# Altium schematic sheet ffultra_MCU.SchDoc: Firefly Mini MCU
size Legal; DrawnBy: Jakub Czarny; SheetNumber: 2; SheetTotal: 13
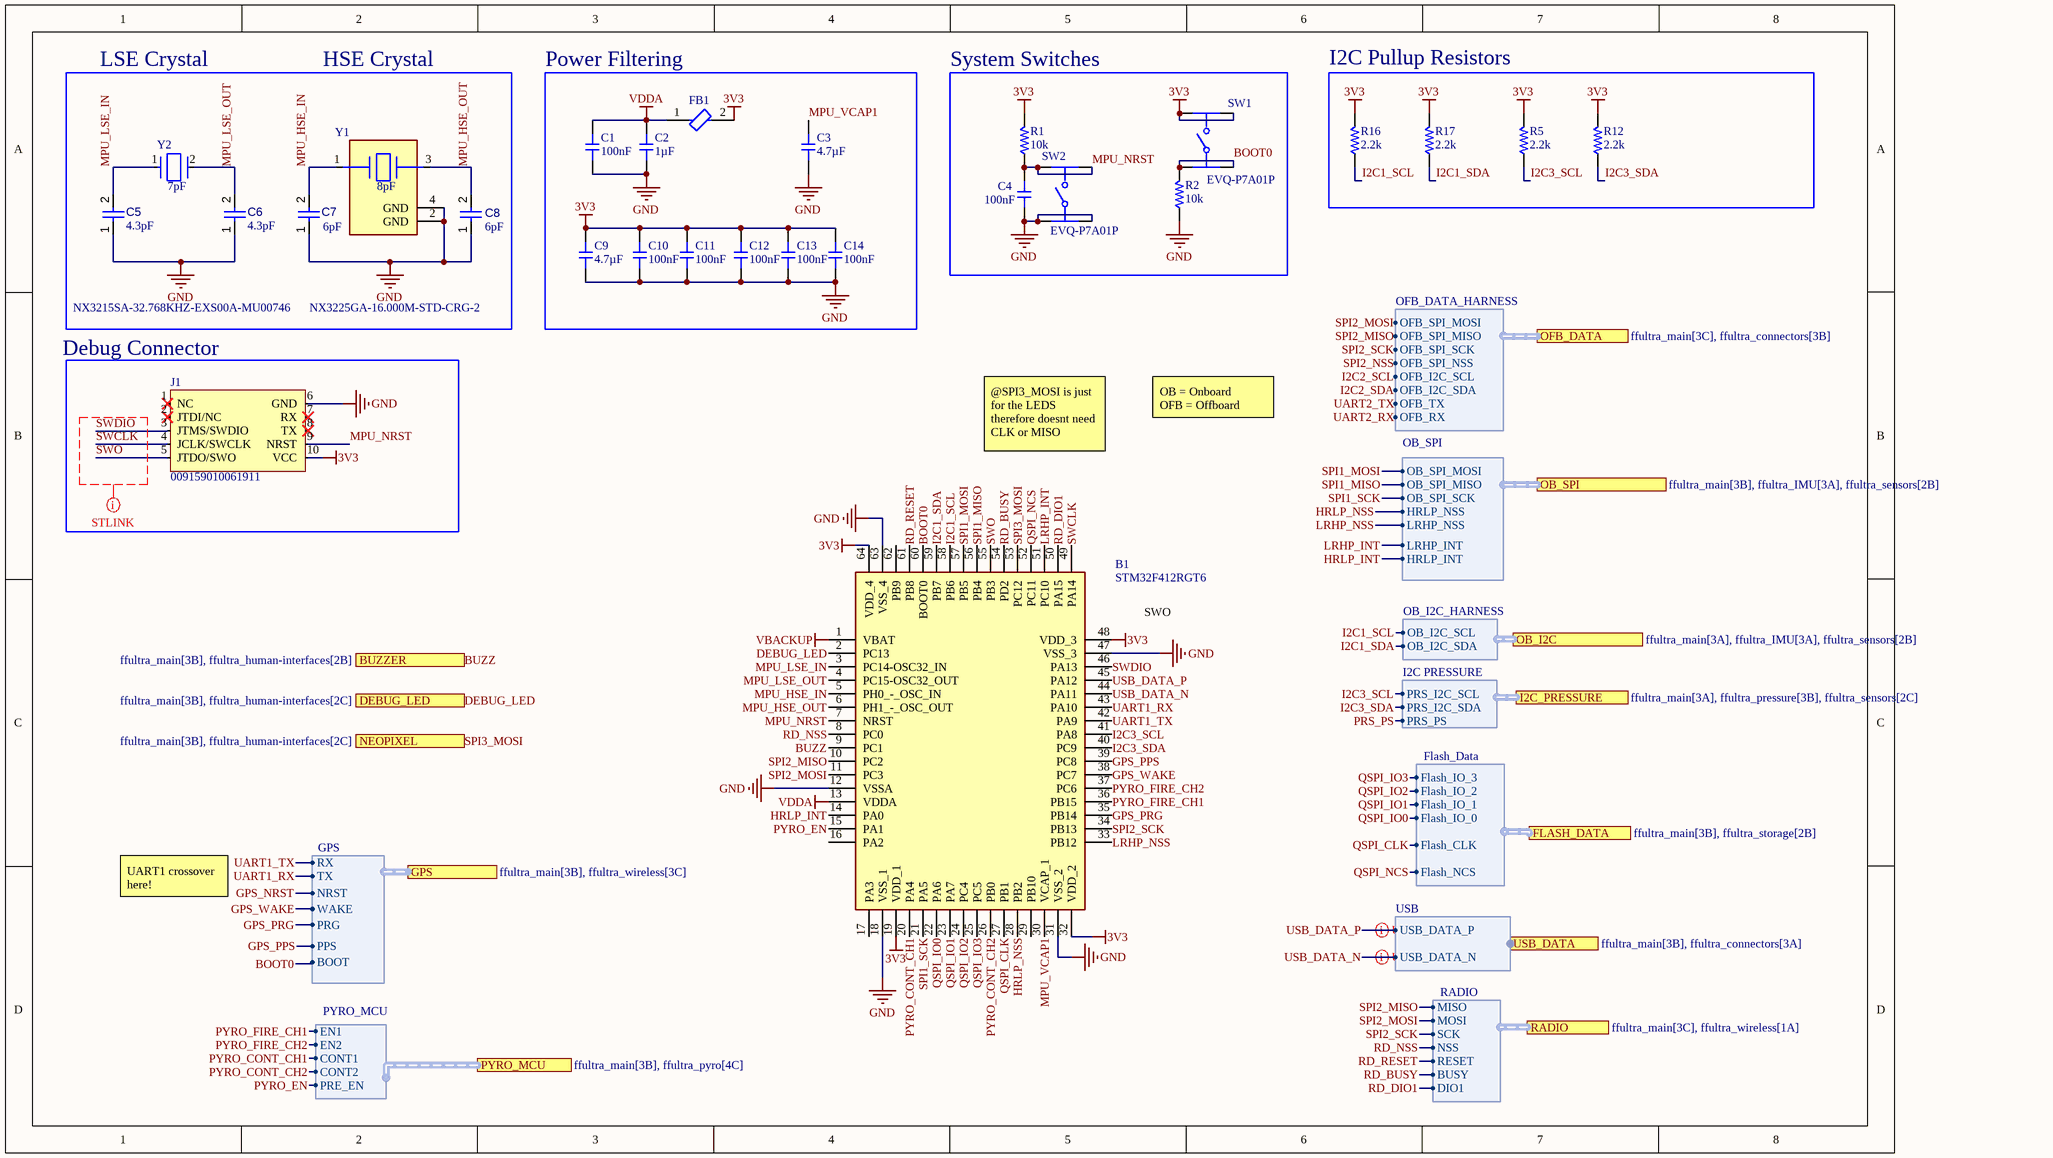
[diagram p0: ffultra_MCU.SchDoc]

## Parts
B1  STM32F412RGT6  [QFP50P1200X1200X160-64N]
C1  value 100nF  [CAP-0402]  (hidden comment: CL05B104KO5NNNC)
C2  value 1µF  [CAP-0402]  (hidden comment: CL05A105KA5NQNC)
C3  value 4.7µF  [CAP-0402]  (hidden comment: CL05A475MP5NRNC)
C4  value 100nF  [CAP-0402]  (hidden comment: CL05B104KO5NNNC)
C5  value 4.3pF  [CAP-0402]  (hidden comment: C1005NP0439CGTS)
C6  value 4.3pF  [CAP-0402]  (hidden comment: C1005NP0439CGTS)
C7  value 6pF  [CAP-0402]  (hidden comment: 0402CG6R0C500NT)
C8  value 6pF  [CAP-0402]  (hidden comment: 0402CG6R0C500NT)
C9  value 4.7µF  [CAP-0402]  (hidden comment: CL05A475MP5NRNC)
C10  value 100nF  [CAP-0402]  (hidden comment: CL05B104KO5NNNC)
C11  value 100nF  [CAP-0402]  (hidden comment: CL05B104KO5NNNC)
C12  value 100nF  [CAP-0402]  (hidden comment: CL05B104KO5NNNC)
C13  value 100nF  [CAP-0402]  (hidden comment: CL05B104KO5NNNC)
C14  value 100nF  [CAP-0402]  (hidden comment: CL05B104KO5NNNC)
FB1  BLM15AG601SN1D  [FP-BLM15-0_05-IPC_A]  (value not drawn)
J1  009159010061911  [009159010061911-Footprint-1]  (no BOM)
R1  value 10k  [RES-0402]  (hidden comment: 0402WGF1002TCE)
R2  value 10k  [RES-0402]  (hidden comment: 0402WGF1002TCE)
R5  value 2.2k  [RES-0402]  (hidden comment: 0402WGF2201TCE)
R12  value 2.2k  [RES-0402]  (hidden comment: 0402WGF2201TCE)
R16  value 2.2k  [RES-0402]  (hidden comment: 0402WGF2201TCE)
R17  value 2.2k  [RES-0402]  (hidden comment: 0402WGF2201TCE)
SW1  EVQ-P7A01P  [FP-EVQ-P7A01P-MFG]
SW2  EVQ-P7A01P  [FP-EVQ-P7A01P-MFG]
Y1  NX3225GA-16.000M-STD-CRG-2  value 8pF  [FP-NX3225GA-MFG]
Y2  NX3215SA-32.768KHZ-EXS00A-MU00746  value 7pF  [FP-NX3215SA-MFG]

## Blocks framed on the sheet
Power Filtering: C1-C3 C9-C14 FB1
System Switches: C4 R1 R2 SW1 SW2
I2C Pullup Resistors: R5 R12 R16 R17

## Ports
BUZZER (out, see ffultra_main[3B], ffultra_human-interfaces[2B]), DEBUG_LED (out, see ffultra_main[3B], ffultra_human-interfaces[2C]), FLASH_DATA (harness Flash_Data, see ffultra_main[3B], ffultra_storage[2B]), GPS (harness GPS, see ffultra_main[3B], ffultra_wireless[3C]), I2C_PRESSURE (harness I2C PRESSURE, see ffultra_main[3A], ffultra_pressure[3B], ffultra_sensors[2C]), NEOPIXEL (out, see ffultra_main[3B], ffultra_human-interfaces[2C]), OB_I2C (harness OB_I2C_HARNESS, see ffultra_main[3A], ffultra_IMU[3A], ffultra_sensors[2B]), OB_SPI (harness OB_SPI, see ffultra_main[3B], ffultra_IMU[3A], ffultra_sensors[2B]), OFB_DATA (harness OFB_DATA_HARNESS, see ffultra_main[3C], ffultra_connectors[3B]), PYRO_MCU (harness PYRO_MCU, see ffultra_main[3B], ffultra_pyro[4C]), RADIO (harness RADIO, see ffultra_main[3C], ffultra_wireless[1A]), USB_DATA (harness USB, see ffultra_main[3B], ffultra_connectors[3A])

## Harnesses
OB_I2C_HARNESS: OB_I2C_SCL, OB_I2C_SDA
Flash_Data: Flash_NCS, Flash_CLK, Flash_IO_0, Flash_IO_1, Flash_IO_2, Flash_IO_3
GPS: RX, TX, NRST, WAKE, PRG, PPS, BOOT
PYRO_MCU: EN1, EN2, CONT1, CONT2, PRE_EN
RADIO: MISO, MOSI, SCK, NSS, RESET, BUSY, DIO1
I2C PRESSURE: PRS_I2C_SCL, PRS_I2C_SDA, PRS_PS
USB: USB_DATA_P, USB_DATA_N
OFB_DATA_HARNESS: OFB_SPI_MOSI, OFB_SPI_MISO, OFB_SPI_SCK, OFB_I2C_SCL, OFB_I2C_SDA, OFB_SPI_NSS, OFB_TX, OFB_RX
OB_SPI: OB_SPI_MOSI, OB_SPI_MISO, OB_SPI_SCK, HRLP_INT, LRHP_NSS, HRLP_NSS, LRHP_INT

## Nets
3V3: B1.19(VDD_1) B1.32(VDD_2) B1.48(VDD_3) B1.64(VDD_4) C9.2 C10.2 C11.2 C12.2 C13.2 C14.2 FB1.2 J1.10(VCC) R1.2 R5.2 R12.2 R16.2 R17.2 SW1.1 SW1.1'
GND: B1.12(VSSA) B1.18(VSS_1) B1.31(VSS_2) B1.47(VSS_3) B1.63(VSS_4) C1.1 C2.1 C3.1 C4.1 C5.1 C6.1 C7.1 C8.1 C9.1 C10.1 C11.1 C12.1 C13.1 C14.1 J1.6(GND) R2.1 SW2.2 SW2.2' Y1.2(GND) Y1.4(GND)
VBACKUP: B1.1(VBAT)
VDDA: B1.13(VDDA) C1.2 C2.2 FB1.1
BOOT0: B1.60(BOOT0) R2.2 SW1.2 SW1.2' ; port GPS.BOOT
BUZZ: B1.9(PC1) ; port BUZZER
DEBUG_LED: B1.2(PC13) ; port DEBUG_LED
GPS_NRST: port GPS.NRST
GPS_PPS: B1.39(PC8) ; port GPS.PPS
GPS_PRG: B1.35(PB14) ; port GPS.PRG
GPS_WAKE: B1.38(PC7) ; port GPS.WAKE
HRLP_INT: B1.14(PA0) ; port OB_SPI.HRLP_INT
HRLP_NSS: B1.28(PB2) ; port OB_SPI.HRLP_NSS
I2C1_SCL: B1.58(PB6) R16.1 ; port OB_I2C.OB_I2C_SCL
I2C1_SDA: B1.59(PB7) R17.1 ; port OB_I2C.OB_I2C_SDA
I2C2_SCL: port OFB_DATA.OFB_I2C_SCL
I2C2_SDA: port OFB_DATA.OFB_I2C_SDA
I2C3_SCL: B1.41(PA8) R5.1 ; port I2C_PRESSURE.PRS_I2C_SCL
I2C3_SDA: B1.40(PC9) R12.1 ; port I2C_PRESSURE.PRS_I2C_SDA
LRHP_INT: B1.51(PC10) ; port OB_SPI.LRHP_INT
LRHP_NSS: B1.33(PB12) ; port OB_SPI.LRHP_NSS
MPU_HSE_IN: B1.5(PH0_-_OSC_IN) C7.2 Y1.1
MPU_HSE_OUT: B1.6(PH1_-_OSC_OUT) C8.2 Y1.3
MPU_LSE_IN: B1.3(PC14-OSC32_IN) C5.2 Y2.1
MPU_LSE_OUT: B1.4(PC15-OSC32_OUT) C6.2 Y2.2
MPU_NRST: B1.7(NRST) C4.2 J1.9(NRST) R1.1 SW2.1 SW2.1'
MPU_VCAP1: B1.30(VCAP_1) C3.2
PRS_PS: port I2C_PRESSURE.PRS_PS
PYRO_CONT_CH1: B1.20(PA4) ; port PYRO_MCU.CONT1
PYRO_CONT_CH2: B1.26(PB0) ; port PYRO_MCU.CONT2
PYRO_EN: B1.15(PA1) ; port PYRO_MCU.PRE_EN
PYRO_FIRE_CH1: B1.36(PB15) ; port PYRO_MCU.EN1
PYRO_FIRE_CH2: B1.37(PC6) ; port PYRO_MCU.EN2
QSPI_CLK: B1.27(PB1) ; port FLASH_DATA.Flash_CLK
QSPI_IO0: B1.22(PA6) ; port FLASH_DATA.Flash_IO_0
QSPI_IO1: B1.23(PA7) ; port FLASH_DATA.Flash_IO_1
QSPI_IO2: B1.24(PC4) ; port FLASH_DATA.Flash_IO_2
QSPI_IO3: B1.25(PC5) ; port FLASH_DATA.Flash_IO_3
QSPI_NCS: B1.52(PC11) ; port FLASH_DATA.Flash_NCS
RD_BUSY: B1.54(PD2) ; port RADIO.BUSY
RD_DIO1: B1.50(PA15) ; port RADIO.DIO1
RD_NSS: B1.8(PC0) ; port RADIO.NSS
RD_RESET: B1.61(PB8) ; port RADIO.RESET
SPI1_MISO: B1.56(PB4) ; port OB_SPI.OB_SPI_MISO
SPI1_MOSI: B1.57(PB5) ; port OB_SPI.OB_SPI_MOSI
SPI1_SCK: B1.21(PA5) ; port OB_SPI.OB_SPI_SCK
SPI2_MISO: B1.10(PC2) ; port RADIO.MISO, port OFB_DATA.OFB_SPI_MISO
SPI2_MOSI: B1.11(PC3) ; port RADIO.MOSI, port OFB_DATA.OFB_SPI_MOSI
SPI2_NSS: port OFB_DATA.OFB_SPI_NSS
SPI2_SCK: B1.34(PB13) ; port RADIO.SCK, port OFB_DATA.OFB_SPI_SCK
SPI3_MOSI: B1.53(PC12) ; port NEOPIXEL
SWCLK: B1.49(PA14) J1.4(JCLK/SWCLK)
SWDIO: B1.46(PA13) J1.3(JTMS/SWDIO)
SWO: B1.55(PB3) J1.5(JTDO/SWO)
UART1_RX: B1.43(PA10) ; port GPS.TX
UART1_TX: B1.42(PA9) ; port GPS.RX
UART2_RX: port OFB_DATA.OFB_RX
UART2_TX: port OFB_DATA.OFB_TX
USB_DATA_N: B1.44(PA11) ; port USB_DATA.USB_DATA_N
USB_DATA_P: B1.45(PA12) ; port USB_DATA.USB_DATA_P

Not connected (* = marked no-connect by the designer): B1 16(PA2) 17(PA3) 29(PB10) 62(PB9); J1 1(NC)* 2(JTDI/NC)* 7(RX)* 8(TX)*

## Layout directives
rule Matched Net Lengths [Tolerance = 0.1mm]; net class STLINK: SWCLK, SWDIO, SWO
differential pair: USB_DATA_N, USB_DATA_P

## Notes on the sheet
- LSE Crystal
- HSE Crystal
- (near J1) Debug Connector
- OB = Onboard
  OFB = Offboard
- @SPI3_MOSI is just for the LEDS therefore doesnt need CLK or MISO
- SWO
- UART1 crossover here!

## Library data of the parts
B1 = CMP-020-00025-2: ARM Microcontrollers - MCU 16/32-BITS MICROS; Manufacturer: STMicroelectronics; Geometry.Height: 1.6mm; Arrow Price/Stock: https://www.arrow.com/en/products/stm32f412rgt6/stmicroelectronics?region=nac; Design Item ID: STM32F412RGT6; Manufacturer_Part_Number: STM32F412RGT6; Mouser Price/Stock: https://www.mouser.co.uk/ProductDetail/STMicroelectronics/STM32F412RGT6?qs=qzCNEk%252BRr%252Bb0WoPVhlRQfQ%3D%3D; Mouser Part Number: 511-STM32F412RGT6; Source: STM32F412RGT6.SchLib; Arrow Part Number: STM32F412RGT6; Datasheet Link: http://www.st.com/content/ccc/resource/technical/document/datasheet/15/90/07/b3/8c/10/4e/95/DM00213872.pdf/files/DM00213872.pdf/jcr:content/translations/en.DM00213872.pdf; JLCPCB Part Number: C94351
C1 C4 C10-C14 = CMP-001-00142-1: Capacitor, Ceramic (MLCC), 100nF, ±10%, 16V, X7R, ±10%, SMD 0402; Manufacturer: Samsung Electro-Mechanics; Design Item ID: CL05B104KO5NNNC; Source: jlcpcb_capacitors_basic.schlib; ComponentLink2URL: https://jlcpcb.com/partdetail/C1525; Voltage Rating: 16V; Tolerance: 10%; Temperature Coefficient: X7R; ComponentLink2Description: JLCPCB Part URL; ComponentLink1URL: https://datasheet.lcsc.com/lcsc/1810191219_Samsung-Electro-Mechanics-CL05B104KO5NNNC_C1525.pdf; JLCPCB Basic Part: Yes; JLCPCB Part Number: C1525; ComponentLink3URL: https://lcsc.com/product-detail/Multilayer-Ceramic-Capacitors-MLCC---SMD-SMT_Samsung-Electro-Mechanics-Samsung-Electro-Mechanics-CL05B104KO5NNNC_C1525.html; Manufacturer Part Number: CL05B104KO5NNNC; ComponentLink1Description: Datasheet; Case/Package: 0402; RoHS: Yes; Category: Capacitors - MLCC; ComponentLink3Description: LCSC Part URL
C2 = CMP-001-00135-1: Capacitor, Ceramic (MLCC), 1uF, ±10%, 25V, X5R, ±10%, SMD 0402; Manufacturer: Samsung Electro-Mechanics; Voltage Rating: 25V; RoHS: Yes; Temperature Coefficient: X5R; Tolerance: 10%; Source: jlcpcb_capacitors_basic.schlib; ComponentLink1URL: https://datasheet.lcsc.com/lcsc/1811091611_Samsung-Electro-Mechanics-CL05A105KA5NQNC_C52923.pdf; JLCPCB Basic Part: Yes; ComponentLink1Description: Datasheet; ComponentLink2URL: https://jlcpcb.com/partdetail/C52923; Case/Package: 0402; ComponentLink3Description: LCSC Part URL; Manufacturer Part Number: CL05A105KA5NQNC; ComponentLink3URL: https://lcsc.com/product-detail/Multilayer-Ceramic-Capacitors-MLCC---SMD-SMT_Samsung-Electro-Mechanics-Samsung-Electro-Mechanics-CL05A105KA5NQNC_C52923.html; Design Item ID: CL05A105KA5NQNC; JLCPCB Part Number: C52923; ComponentLink2Description: JLCPCB Part URL; Category: Capacitors - MLCC
C3 C9 = CMP-001-00139-1: Capacitor, Ceramic (MLCC), 4.7uF, ±20%, 10V, X5R, ±20%, SMD 0402; Manufacturer: Samsung Electro-Mechanics; RoHS: Yes; Tolerance: 20%; Manufacturer Part Number: CL05A475MP5NRNC; ComponentLink3Description: LCSC Part URL; Source: jlcpcb_capacitors_basic.schlib; JLCPCB Part Number: C23733; ComponentLink2Description: JLCPCB Part URL; Temperature Coefficient: X5R; Voltage Rating: 10V; JLCPCB Basic Part: Yes; Case/Package: 0402; Category: Capacitors - MLCC; ComponentLink1URL: https://datasheet.lcsc.com/lcsc/1810191211_Samsung-Electro-Mechanics-CL05A475MP5NRNC_C23733.pdf; ComponentLink2URL: https://jlcpcb.com/partdetail/C23733; ComponentLink1Description: Datasheet; ComponentLink3URL: https://lcsc.com/product-detail/Multilayer-Ceramic-Capacitors-MLCC---SMD-SMT_Samsung-Electro-Mechanics-Samsung-Electro-Mechanics-CL05A475MP5NRNC_C23733.html; Design Item ID: CL05A475MP5NRNC
C5 C6 = CMP-001-02165-2: 50V 4.3pF NP0 0402  Multilayer Ceramic Capacitors MLCC - SMD/SMT ROHS; JLCPCB Part Number: C147367
C7 C8 = CMP-001-02164-2: 50V 6pF C0G 0402  Multilayer Ceramic Capacitors MLCC - SMD/SMT ROHS; JLCPCB Part Number: C1575
FB1 = CMP-006-00022-1: 520mΩ ±25% 600Ω@100MHz 0402  Ferrite Beads ROHS; Current Rating: 300mA; DC Resistance-Max: 520mR; RoHS Compliant: Yes; Max Operating Temperature: 125°C; Construction: Chip Bead; JLCPCB Part Number: C76884; Min Operating Temperature: -55°C; Mounting Technology: Surface Mount; Case Code: 0402
J1 = CMP-002-00088-8: AVX edge to edge connector 10pin; JLCPCB Part Number: C5887432
R1 R2 = CMP-009-00191-1: Resistor, 10kΩ, ±1%, 62.5mW, 50V, ±100ppm/℃, -55℃~+155℃, SMD 0402; Manufacturer: Uniroyal; Temperature Rating: -55℃~+155℃; ComponentLink1URL: https://datasheet.lcsc.com/lcsc/2206010100_UNI-ROYAL-Uniroyal-Elec-0402WGF1002TCE_C25744.pdf; Source: jlcpcb_resistors_basic.schlib; Tolerance: 1%; Design Item ID: 0402WGF1002TCE; ComponentLink1Description: Datasheet; ComponentLink2URL: https://jlcpcb.com/partdetail/C25744; Category: Resistors; JLCPCB Part Number: C25744; ComponentLink2Description: JLCPCB Part URL; Temperature Coefficient: ±100ppm/℃; JLCPCB Basic Part: Yes; Power Rating: 62.5mW; Case/Package: 0402; Voltage Rating: 50V; Manufacturer Part Number: 0402WGF1002TCE
R5 R12 R16 R17 = CMP-009-00211-1: Resistor, 2.2kΩ, ±1%, 62.5mW, 50V, ±100ppm/℃, -55℃~+155℃, SMD 0402; Manufacturer: Uniroyal; Source: jlcpcb_resistors_basic.schlib; JLCPCB Basic Part: Yes; Case/Package: 0402; Category: Resistors; Voltage Rating: 50V; Temperature Rating: -55℃~+155℃; ComponentLink1URL: https://datasheet.lcsc.com/lcsc/2206010045_UNI-ROYAL-Uniroyal-Elec-0402WGF2201TCE_C25879.pdf; Manufacturer Part Number: 0402WGF2201TCE; Tolerance: 1%; Power Rating: 62.5mW; Temperature Coefficient: ±100ppm/℃; ComponentLink2URL: https://jlcpcb.com/partdetail/C25879; ComponentLink1Description: Datasheet; ComponentLink2Description: JLCPCB Part URL; Design Item ID: 0402WGF2201TCE; JLCPCB Part Number: C25879
SW1 SW2 = CMP-011-00021-3: Switch Tactile N.O. SPST Rectangular Button Gull Wing 0.05A 12VDC 2.2N SMD Embossed T/R; JLCPCB Part Number: C79167
Y1 = CMP-003-00030-1: Crystal 16MHz ±20ppm (Tol) ±30ppm (Stability) 8pF FUND 80Ohm Automotive 4-Pin SMD; JLCPCB Part Number: C156247
Y2 = CMP-003-00031-1: Crystal 32.7680KHZ 7PF SMD; JLCPCB Part Number: C70509